# EAGLE design RGBmarker-J008534C (EAGLE 7.7.0)
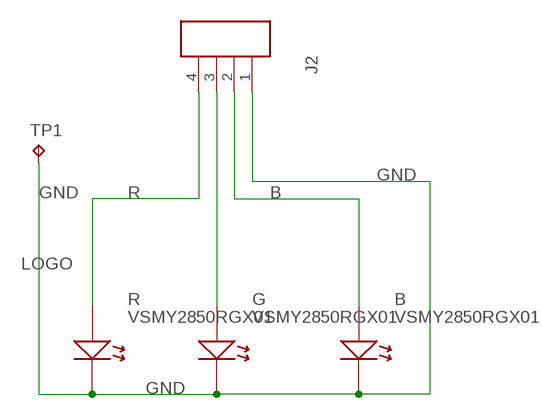
[diagram p0: schematic, sheet 1]

## Parts
B  VSMY2850RGX01  LEDLED-THRU-VSMY  [LED_THRU_VSMY]
G  VSMY2850RGX01  LEDLED-THRU-VSMY  [LED_THRU_VSMY]
J2  CON4533980471  [533980471]
R  VSMY2850RGX01  LEDLED-THRU-VSMY  [LED_THRU_VSMY]
TP1  TPB1,27  [B1,27]
U$1  JFRC-LOGOLOGO_OP  [LOGO_BMP_OP]

## Nets
B: B.A J2.2
GND: B.C(K) G.C(K) J2.1 R.C(K) TP1.TP
N$1: G.A J2.3
R: J2.4 R.A

## Library data of the parts
B G R = STEVES_BU:LED
J2 = STEVES_BU:CON4
TP1 = testpad:TP: Test pad
U$1 = STEVES_BU:JFRC-LOGO

## Board
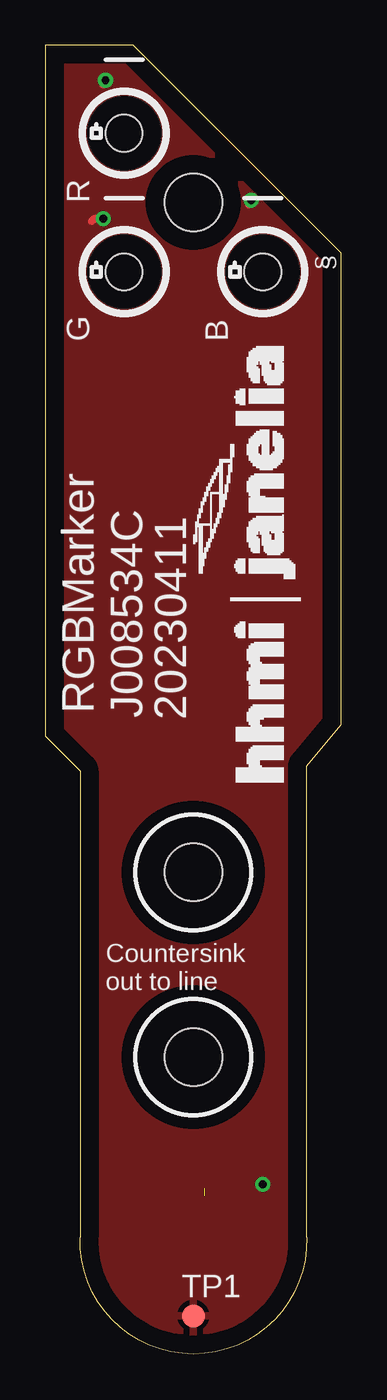
[diagram p1: board, top side]
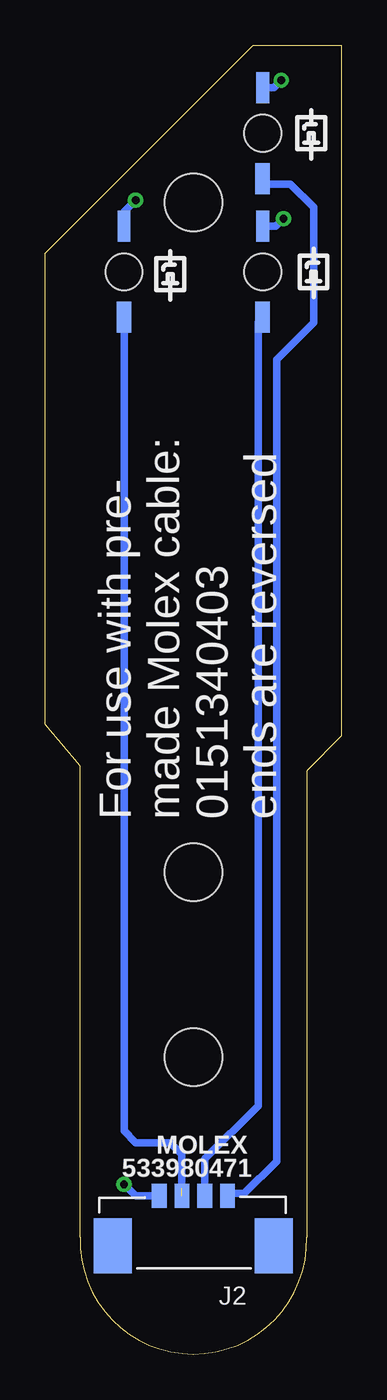
[diagram p2: board, bottom side, seen from below]

Size 16.26 x 71.95 mm. Coordinates in mm from the lower left corner, seen from the top.
Outline: 14.35,6.42 14.35,32.32 16.26,34.61 16.26,60.52 4.83,71.95 0,71.95 0,33.98 1.91,32.07 1.91,6.42 arc184 14.35,6.42
Copper layers (1*16): Top 0.035mm / dielectric 1.5mm / Bottom 0.035mm
Design rules "default": minimum track width 10mil, minimum drill 24mil, track to track 8mil, track to pad 8mil, pad to pad 8mil, via to via 8mil, smd to smd 8mil, copper to edge 40mil, drill to drill 8mil, minimum pad ring 10mil, minimum via ring 8mil, stop-mask expansion 4mil, vias tented up to drill 0mil, thermal gap 10mil
Holes 3.17 mm at 8.13,63.31 8.13,26.48 8.13,16.32
tRestrict: area 5.1,13.3 to 11.2,19.4; area 5.1,23.4 to 11.2,29.5

### Footprints (pad centres in the part's own frame; a part is rotated, then mirrored left to right if it is on the bottom)
LED_THRU_VSMY = smd 1.7 x 0.8 bottom: A -2.5,0 | smd 1.7 x 0.7 bottom: C 2.5,0 | hole 2.032: 0,0
533980471 = smd 0.8 x 1.3: 1 1.875,0; 2 0.625,0; 3 -0.625,0; 4 -1.875,0 | smd 2.1 x 3: A -4.425,2.75; B 4.425,2.75
B1,27 = smd 1.27 x 1.27: TP 0,0

### Placement (x,y rotation side)
B  11.94,59.5 90 top
G  4.32,59.5 90 top
J2  8.13,8.7 180 bottom
R  4.32,67.12 90 top
TP1  8.13,2.1 0 top
U$1  12.57,41.6 90 top

### Tracks (layer width: path | path; a pad name or v marks a point on that pad's centre or on a via)
B  (1 unrouted)
  Bottom 0.406: B.A 11.94,12.26 11.3,11.62 9.4,11.62 8.76,10.99 J2.2 | 8.75,9.1 8.76,9.11
GND  (via drill 0.43)
  Top 0.406: v11.94,9.34 11.94,9.21 | v11.3,63.44 11.3,63.31 11.18,63.19 | v3.18,62.42 2.67,62.42 2.54,62.3 | v3.3,70.04 3.3,69.92 3.18,69.79
  Bottom 0: B.C 11.94,62.68 11.3,63.31
  Bottom 0.406: 11.98,62.04 B.C 11.94,62.8 v11.3,63.44 | J2.1 11.3,8.7 v11.94,9.34 | G.C 3.6,62 v3.18,62.42 | R.C 3.72,69.62 v3.3,70.04
  pour Top: -1.65,72.96 17.15,73.85 16.51,0.32 -0.89,0.7
N$1
  Bottom 0.406: J2.3 7.5,10.72 4.57,13.66 4.57,56.75 G.A
R
  Bottom 0.406: 3.56,54.68 3.3,54.93 | 3.3,54.93 1.52,56.71 1.52,63.06 2.79,64.33 4.02,64.33 R.A | 3.56,54.68 3.56,11.24 3.56,10.61 5.33,8.83 6.13,8.83 J2.4 | 3.56,54.68 3.3,54.93

### Text on the board
tPlace: S | S | RGBMarker | J008534C | 20230411 | Countersink / out to line
bPlace: For use with pre- / made Molex cable: / 0151340403 / ends are reversed | MOLEX | 533980471